# Altium project PCB2_OBC_ADCS.PrjPcb
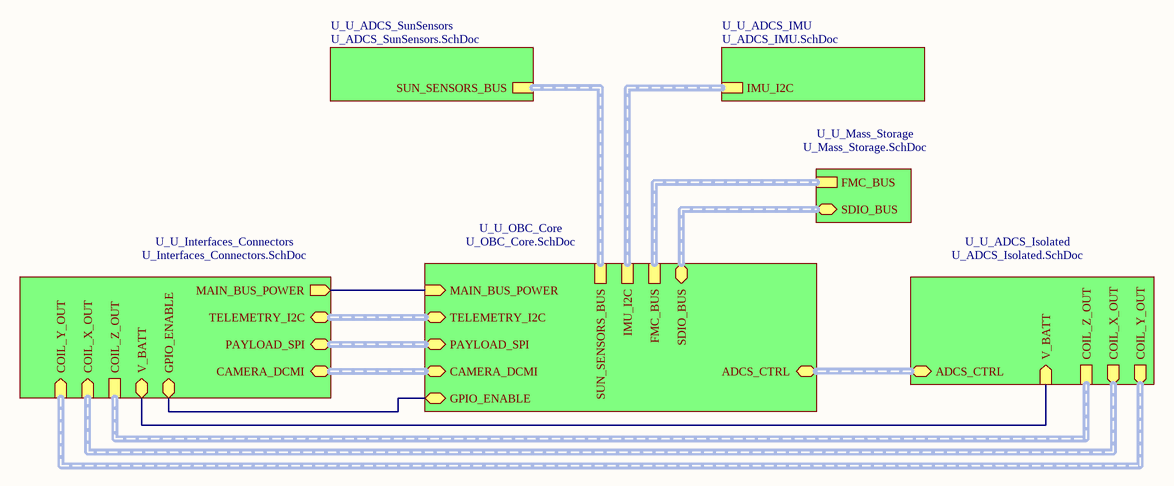
[diagram p0: Top_Level.SchDoc]
9 sheets, 53 parts. Net scope: hierarchical (ports join the sheet entries above them; power ports are global).
Board files: PCB2_OBC_ADCS_Base_Comun.PcbDoc, PCB2_OBC_ADCS_asistida.PcbDoc, PCB2_OBC_ADCS_Auto.PcbDoc
Sheets:
  Top_Level.SchDoc
    U_U_OBC_Core = U_OBC_Core.SchDoc
    U_U_Mass_Storage = U_Mass_Storage.SchDoc
      U_U_SDRAM = U_SDRAM.SchDoc
      U_U_eMMC = U_eMMC.SchDoc
    U_U_ADCS_Isolated = U_ADCS_Isolated.SchDoc
    U_U_Interfaces_Connectors = U_Interfaces_Connectors.SchDoc
    U_U_ADCS_IMU = U_ADCS_IMU.SchDoc
    U_U_ADCS_SunSensors = U_ADCS_SunSensors.SchDoc

## Sheet Top_Level.SchDoc
size A4; SheetNumber: 1; SheetTotal: 9

### Sub-sheets
U_U_ADCS_IMU = U_ADCS_IMU.SchDoc: IMU_I2C (harness IMU_I2C_DEF)
U_U_ADCS_Isolated = U_ADCS_Isolated.SchDoc: ADCS_CTRL (bidir, harness ADCS_CTRL_DEF), COIL_Y_OUT (out, harness COIL_Y_DEF), COIL_X_OUT (out, harness COIL_X_DEF), V_BATT (in), COIL_Z_OUT (harness COIL_Z_DEF)
U_U_ADCS_SunSensors = U_ADCS_SunSensors.SchDoc: SUN_SENSORS_BUS (harness SUN_ADC_DEF)
U_U_Interfaces_Connectors = U_Interfaces_Connectors.SchDoc: MAIN_BUS_POWER (out), TELEMETRY_I2C (bidir, harness I2C_DEF), PAYLOAD_SPI (bidir, harness PAYLOAD_SPI_TYPE), CAMERA_DCMI (bidir, harness DCMI_DEF), GPIO_ENABLE (bidir), COIL_Y_OUT (in, harness COIL_Y_DEF), COIL_X_OUT (in, harness COIL_X_DEF), V_BATT (bidir), COIL_Z_OUT (harness COIL_Z_DEF)
U_U_Mass_Storage = U_Mass_Storage.SchDoc: SDIO_BUS (bidir, harness SDIO_BUS_TYPE), FMC_BUS (harness FMC_BUS_TYPE)
U_U_OBC_Core = U_OBC_Core.SchDoc: MAIN_BUS_POWER (in), TELEMETRY_I2C (bidir, harness I2C_DEF), PAYLOAD_SPI (bidir, harness PAYLOAD_SPI_TYPE), CAMERA_DCMI (bidir, harness DCMI_DEF), ADCS_CTRL (bidir, harness ADCS_CTRL_DEF), GPIO_ENABLE (bidir), SUN_SENSORS_BUS (harness SUN_ADC_DEF), IMU_I2C (harness IMU_I2C_DEF), FMC_BUS (harness FMC_BUS_TYPE), SDIO_BUS (bidir, harness SDIO_BUS_TYPE)

### Nets
V_BATT: sheet U_U_ADCS_Isolated/V_BATT, sheet U_U_Interfaces_Connectors/V_BATT
NetC6_1: sheet U_U_OBC_Core/MAIN_BUS_POWER, sheet U_U_Interfaces_Connectors/MAIN_BUS_POWER
NetJ5_2: sheet U_U_OBC_Core/GPIO_ENABLE, sheet U_U_Interfaces_Connectors/GPIO_ENABLE

### Buses and harness runs
harness sheet U_U_ADCS_IMU/IMU_I2C = sheet U_U_OBC_Core/IMU_I2C
harness sheet U_U_ADCS_Isolated/ADCS_CTRL = sheet U_U_OBC_Core/ADCS_CTRL
harness sheet U_U_ADCS_Isolated/COIL_X_OUT = sheet U_U_Interfaces_Connectors/COIL_X_OUT
harness sheet U_U_ADCS_Isolated/COIL_Y_OUT = sheet U_U_Interfaces_Connectors/COIL_Y_OUT
harness sheet U_U_ADCS_Isolated/COIL_Z_OUT = sheet U_U_Interfaces_Connectors/COIL_Z_OUT
harness sheet U_U_ADCS_SunSensors/SUN_SENSORS_BUS = sheet U_U_OBC_Core/SUN_SENSORS_BUS
harness sheet U_U_Interfaces_Connectors/CAMERA_DCMI = sheet U_U_OBC_Core/CAMERA_DCMI
harness sheet U_U_Interfaces_Connectors/PAYLOAD_SPI = sheet U_U_OBC_Core/PAYLOAD_SPI
harness sheet U_U_Interfaces_Connectors/TELEMETRY_I2C = sheet U_U_OBC_Core/TELEMETRY_I2C
harness sheet U_U_Mass_Storage/FMC_BUS = sheet U_U_OBC_Core/FMC_BUS
harness sheet U_U_Mass_Storage/SDIO_BUS = sheet U_U_OBC_Core/SDIO_BUS

## Sheet U_OBC_Core.SchDoc
size A3; SheetNumber: 2; SheetTotal: 9
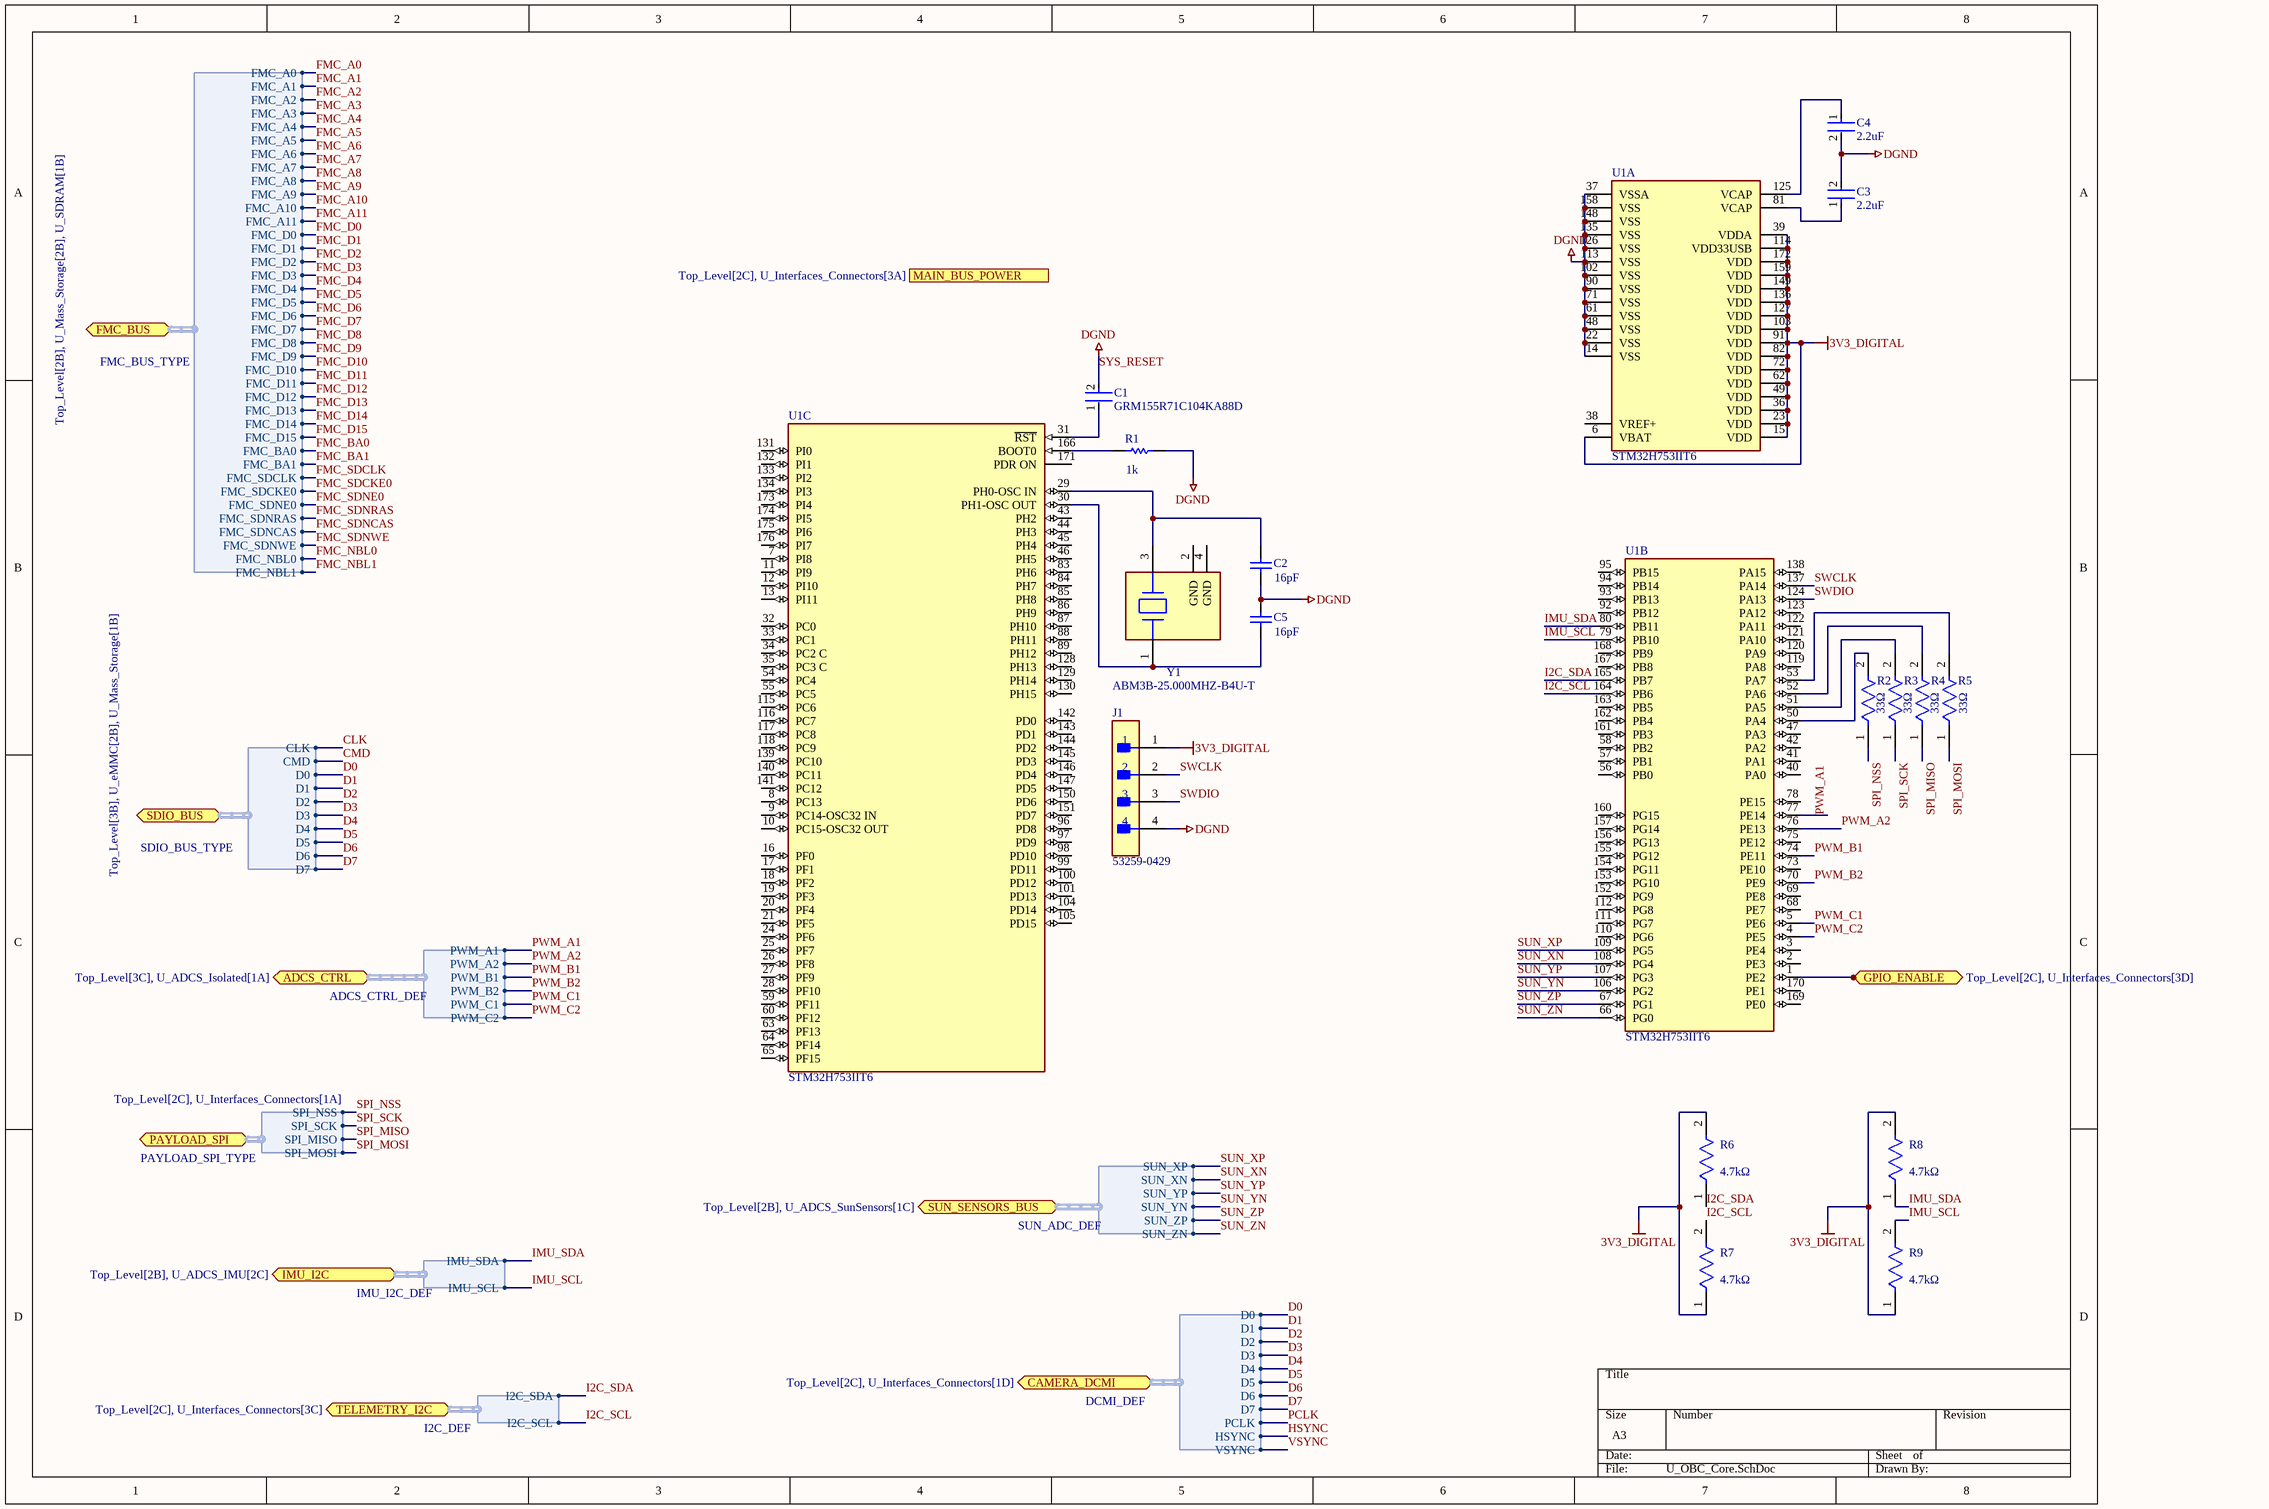
[diagram p1: U_OBC_Core.SchDoc]

### Parts
C1  GRM155R71C104KA88D  [FP-GRM15-MFG]
C2  16pF  [CAPC1005X55X25NL05T10]
C3  2.2uF  [FP-GRM188-0_1-e0_2_0_5-MFG]
C4  2.2uF  [FP-GRM188-0_1-e0_2_0_5-MFG]
C5  16pF  [CAPC1005X55X25NL05T10]
J1  53259-0429  [FP-53259-0429-MFG]
R1  1k  [RESC1609X55X30LL15T15]
R2  33Ω  [FP-CRCW0603-e3-IPC_A]
R3  33Ω  [FP-CRCW0603-e3-IPC_A]
R4  33Ω  [FP-CRCW0603-e3-IPC_A]
R5  33Ω  [FP-CRCW0603-e3-IPC_A]
R6  4.7kΩ  [FP-CRCW0603-e3-IPC_A]
R7  4.7kΩ  [FP-CRCW0603-e3-IPC_A]
R8  4.7kΩ  [FP-CRCW0603-e3-IPC_A]
R9  4.7kΩ  [FP-CRCW0603-e3-IPC_A]
U1  STM32H753IIT6  [FP-LQFP176-1T-IPC_B]  (parts A,B,C of 3)
Y1  ABM3B-25.000MHZ-B4U-T  [FP-ABM3B-MFG]

### Ports
ADCS_CTRL (bidir, harness ADCS_CTRL_DEF, see Top_Level[3C], U_ADCS_Isolated[1A]), CAMERA_DCMI (bidir, harness DCMI_DEF, see Top_Level[2C], U_Interfaces_Connectors[1D]), FMC_BUS (bidir, harness FMC_BUS_TYPE, see Top_Level[2B], U_Mass_Storage[2B], U_SDRAM[1B]), GPIO_ENABLE (bidir, see Top_Level[2C], U_Interfaces_Connectors[3D]), IMU_I2C (bidir, harness IMU_I2C_DEF, see Top_Level[2B], U_ADCS_IMU[2C]), MAIN_BUS_POWER (in, see Top_Level[2C], U_Interfaces_Connectors[3A]), PAYLOAD_SPI (bidir, harness PAYLOAD_SPI_TYPE, see Top_Level[2C], U_Interfaces_Connectors[1A]), SDIO_BUS (bidir, harness SDIO_BUS_TYPE, see Top_Level[3B], U_eMMC[2B], U_Mass_Storage[1B]), SUN_SENSORS_BUS (bidir, harness SUN_ADC_DEF, see Top_Level[2B], U_ADCS_SunSensors[1C]), TELEMETRY_I2C (bidir, harness I2C_DEF, see Top_Level[2C], U_Interfaces_Connectors[3C])

### Harnesses
PAYLOAD_SPI_TYPE: SPI_NSS, SPI_SCK, SPI_MISO, SPI_MOSI
SDIO_BUS_TYPE: CLK, CMD, D0, D1, D2, D3, D4, D5, D6, D7
FMC_BUS_TYPE: FMC_D2, FMC_D3, FMC_D4, FMC_D5, FMC_D6, FMC_D7, FMC_D8, FMC_D9, FMC_D10, FMC_D11, FMC_D12, FMC_D13, FMC_D14, FMC_D1, FMC_D15, FMC_D0, FMC_A0, FMC_A1, FMC_A2, FMC_A3, FMC_A4, FMC_A5, FMC_A6, FMC_A7, FMC_A8, FMC_A9, FMC_A10, FMC_A11, FMC_BA0, FMC_BA1, FMC_SDCLK, FMC_SDCKE0, FMC_SDNE0, FMC_SDNRAS, FMC_SDNCAS, FMC_SDNWE, FMC_NBL0, FMC_NBL1
I2C_DEF: I2C_SDA, I2C_SCL
DCMI_DEF: D0, D1, D2, D3, D4, D5, D6, D7, PCLK, HSYNC, VSYNC
IMU_I2C_DEF: IMU_SDA, IMU_SCL
SUN_ADC_DEF: SUN_XP, SUN_XN, SUN_YP, SUN_YN, SUN_ZP, SUN_ZN
ADCS_CTRL_DEF: PWM_A1, PWM_A2, PWM_B1, PWM_B2, PWM_C1, PWM_C2

### Nets
3V3_DIGITAL: J1.1 R6.2 R7.1 R8.2 R9.1 U1.6(VBAT) U1.15(VDD) U1.23(VDD) U1.36(VDD) U1.39(VDDA) U1.49(VDD) U1.62(VDD) U1.72(VDD) U1.82(VDD) U1.91(VDD) U1.103(VDD) U1.114(VDD33USB) U1.127(VDD) U1.136(VDD) U1.149(VDD) U1.159(VDD) U1.172(VDD)
DGND: C1.2 C2.1 C3.2 C4.2 C5.1 J1.4 R1.2 U1.14(VSS) U1.22(VSS) U1.37(VSSA) U1.48(VSS) U1.61(VSS) U1.71(VSS) U1.90(VSS) U1.102(VSS) U1.113(VSS) U1.126(VSS) U1.135(VSS) U1.148(VSS) U1.158(VSS)  [also labelled SYS_RESET]
D0: port SDIO_BUS.D0, port CAMERA_DCMI.D0
D1: port SDIO_BUS.D1, port CAMERA_DCMI.D1
D2: port SDIO_BUS.D2, port CAMERA_DCMI.D2
D3: port SDIO_BUS.D3, port CAMERA_DCMI.D3
D4: port SDIO_BUS.D4, port CAMERA_DCMI.D4
D5: port SDIO_BUS.D5, port CAMERA_DCMI.D5
D6: port SDIO_BUS.D6, port CAMERA_DCMI.D6
D7: port SDIO_BUS.D7, port CAMERA_DCMI.D7
I2C_SCL: R7.2 U1.164(PB6) ; port TELEMETRY_I2C.I2C_SCL
I2C_SDA: R6.1 U1.165(PB7) ; port TELEMETRY_I2C.I2C_SDA
IMU_SCL: R9.2 U1.79(PB10) ; port IMU_I2C.IMU_SCL
IMU_SDA: R8.1 U1.80(PB11) ; port IMU_I2C.IMU_SDA
PWM_A1: U1.77(PE14) ; port ADCS_CTRL.PWM_A1
PWM_A2: U1.76(PE13) ; port ADCS_CTRL.PWM_A2
PWM_B1: U1.74(PE11) ; port ADCS_CTRL.PWM_B1
PWM_B2: U1.70(PE9) ; port ADCS_CTRL.PWM_B2
PWM_C1: U1.5(PE6) ; port ADCS_CTRL.PWM_C1  [also labelled PWM_C1 ]
PWM_C2: U1.4(PE5) ; port ADCS_CTRL.PWM_C2
SPI_MISO: R4.1 ; port PAYLOAD_SPI.SPI_MISO
SPI_MOSI: R5.1 ; port PAYLOAD_SPI.SPI_MOSI
SPI_NSS: R2.1 ; port PAYLOAD_SPI.SPI_NSS
SPI_SCK: R3.1 ; port PAYLOAD_SPI.SPI_SCK
SUN_XN: U1.108(PG4) ; port SUN_SENSORS_BUS.SUN_XN
SUN_XP: U1.109(PG5) ; port SUN_SENSORS_BUS.SUN_XP
SUN_YN: U1.106(PG2) ; port SUN_SENSORS_BUS.SUN_YN
SUN_YP: U1.107(PG3) ; port SUN_SENSORS_BUS.SUN_YP
SUN_ZN: U1.66(PG0) ; port SUN_SENSORS_BUS.SUN_ZN
SUN_ZP: U1.67(PG1) ; port SUN_SENSORS_BUS.SUN_ZP
SWCLK: J1.2 U1.137(PA14)
SWDIO: J1.3 U1.124(PA13)
NetC1_1: C1.1 U1.31(~{RST})
NetC2_2: C2.2 U1.29(PH0-OSC_IN) Y1.3
NetC3_1: C3.1 U1.81(VCAP)
NetC4_1: C4.1 U1.125(VCAP)
NetC5_2: C5.2 U1.30(PH1-OSC_OUT) Y1.1
NetJ5_2: U1.1(PE2) ; port GPIO_ENABLE
NetR1_1: R1.1 U1.166(BOOT0)
NetR2_2: R2.2 U1.50(PA4)
NetR3_2: R3.2 U1.51(PA5)
NetR4_2: R4.2 U1.52(PA6)
NetR5_2: R5.2 U1.53(PA7)

Not connected (* = marked no-connect by the designer): U1 2(PE3) 3(PE4) 7(PI8) 8(PC13) 9(PC14-OSC32_IN) 10(PC15-OSC32_OUT) 11(PI9) 12(PI10) 13(PI11) 16(PF0) 17(PF1) 18(PF2) 19(PF3) 20(PF4) 21(PF5) 24(PF6) 25(PF7) 26(PF8) 27(PF9) 28(PF10) 32(PC0) 33(PC1) 34(PC2_C) 35(PC3_C) 38(VREF+) 40(PA0) 41(PA1) 42(PA2) 43(PH2) 44(PH3) 45(PH4) 46(PH5) 47(PA3) 54(PC4) 55(PC5) 56(PB0) 57(PB1) 58(PB2) 59(PF11) 60(PF12) 63(PF13) 64(PF14) 65(PF15) 68(PE7) 69(PE8) 73(PE10) 75(PE12) 78(PE15) 83(PH6) 84(PH7) 85(PH8) 86(PH9) 87(PH10) 88(PH11) 89(PH12) 92(PB12) 93(PB13) 94(PB14) 95(PB15) 96(PD8) 97(PD9) 98(PD10) 99(PD11) 100(PD12) 101(PD13) 104(PD14) 105(PD15) 110(PG6) 111(PG7) 112(PG8) 115(PC6) 116(PC7) 117(PC8) 118(PC9) 119(PA8) 120(PA9) 121(PA10) 122(PA11) 123(PA12) 128(PH13) 129(PH14) 130(PH15) 131(PI0) 132(PI1) 133(PI2) 134(PI3) 138(PA15) 139(PC10) 140(PC11) 141(PC12) 142(PD0) 143(PD1) 144(PD2) 145(PD3) 146(PD4) 147(PD5) 150(PD6) 151(PD7) 152(PG9) 153(PG10) 154(PG11) 155(PG12) 156(PG13) 157(PG14) 160(PG15) 161(PB3) 162(PB4) 163(PB5) 167(PB8) 168(PB9) 169(PE0) 170(PE1) 171(PDR_ON) 173(PI4) 174(PI5) 175(PI6) 176(PI7); Y1 2(GND) 4(GND)

### Library data of the parts
C1 = CMP-2100-03641-2: CAP CER 0.1UF 16V X7R 0402; Manufacturer: Murata; Standoff Height: 0mm; Tolerance: 10%; Voltage Rating: 16Vdc; Material: Ceramic; Capacitance: 0.10μF; Value: 0.10μF; RoHS: TRUE; Manufacturer Part Number: GRM155R71C104KA88D; Temperature Characteristic: X7R; Octopart: https://octopart.com/grm155r71c104ka88d-murata-196880; Digikey Description: CAP CER 0.1UF 16V X7R 0402; Device Class L3: Ceramic Capacitors; Height: 0.55mm; ComponentLink2Description: Datasheet; Temperature Range Low: -55°C; Ipc Land Pattern Name: CAPC10050X219; ComponentLink2URL: https://search.murata.co.jp/Ceramy/image/img/A01X/G101/ENG/GRM155R71H471KA01-01A.pdf; Device Class L1: Passive Components; Lead Free: yes; Category: Cap; Package: GRM15; Temperature: -55°C to +125°C; Device Class L2: Capacitors; Temperature Range High: +125°C; Mouser Description: 0402 0.1 uF 16V ±10 % Tolerance X7R SMT Multilayer Ceramic Capacitor
C2 C5 = CMP-2008-03924-1: Manufacturer: Murata; Part Number: GRM1555C1H160JA01D
C3 C4 = CMP-2006-02836-2: Chip Multilayer Ceramic Capacitors for General Purpose, 0603, 2.2uF, X7R, 15%, 10%, 10V; Case Code (Metric): 1608; Height: 0.8mm; Packaging: Cut Tape; Voltage: 10V; Lead Free: Lead Free; Min Operating Temperature: -55°C; Voltage Rating (DC): 10V; Max Operating Temperature: 125°C; Voltage Rating: 10V; Dielectric: X7R; Depth: 0.8mm; Case Code (Imperial): 0603; Termination: SMD/SMT; Case/Package: 0603; Number of Pins: 2; REACH SVHC: No SVHC; Mount: Surface Mount; Width: 0.031inch; Material: Ceramic; Capacitance: 2.2uF; Package Quantity: 1; Weight: 7.1E-05oz; Length: 1.6mm; Thickness: 0.035inch; Tolerance: 10%
J1 = CMP-00257-07647115-1: 53259-0429 Mighty-SPOX Header, 3.50mm Pitch, Right-Angle, 4 Circuits, Brass (CuZn) Contact; Manufacturer Lifecycle Status: ACTIVE; Number of Circuits: 4; Pitch: 3.5mm; Plating: Tin; Glow Wire Compliant: Non-compliant; Voltage Rating: 250V; Current Rating: 5.5A; Contact Material: Brass; NexarPartId: 7647115; Orientation: Right Angle; Termination: Through Hole; Number of Positions: 4; Number of Rows: 1; Country of Origin: KR; RoHS: Compliant; Contact Plating: Tin; Lifecycle Status: Production
R1 = CMP-1012-00623-3: Chip Resistor, 10 KOhm, +/- 1%, 0.1 W, -55 to 155 degC, 0603 (1608 Metric), RoHS, Tape and Reel; Manufacturer: Panasonic; Voltage Rating: 75V; Case\/Package: 0603; Power Rating: 100mW; Resistance: 10KOhm; Temperature Coefficient: 100ppm\/degreesC; Number of Pins: 2; Package Reference: 603; Depth: 0.8mm; Mount: SurfaceMount; Package Description: 2-Pin Surface Mount Device, Body 1.6 x 0.85 mm; Datasheet Version: 02/2017; Length: 1.6mm; Lead Free: LeadFree; Height: 0.45mm; Number of Terminations: 2; Max Power Dissipation: 100mW; Min Operating Temperature: -55degC; Datasheet URL: https://industrial.panasonic.com/cdbs/www-data/pdf/RDA0000/AOA0000C304.pdf; Termination: SMD/SMT; Case Code (Metric): 1608; Case Code (Imperial): 0603; Tolerance: 1%; Max Operating Temperature: 155degC; RoHSCompliant: true; Voltage Rating (DC): 75V; Radiation Hardening: No; Packaging: TapeandReel; Composition: ThickFilm; Mounting Technology: SurfaceMount; Manufacturer URL: http://www.panasonic.com/; Width: 0.031inch; REACH SVHC: NoSVHC; Contact Plating: Tin; Military Standard: Not; Package Quantity: 1
R2-R5 = CMP-2000-03250-2: RES Thick Film, 33Ω, 1%, 0.1W, 100ppm/°C, 0603; Voltage Rating: 75V; Max Power Dissipation: 100mW; Resistance: 33R; Case/Package: 0603; Weight: 7.1E-05oz; Termination: SMD/SMT; Voltage Rating (DC): 75V; Packaging: Tape and Reel; Width: 0.85mm; Depth: 0.85mm; Mount: Surface Mount; Number of Terminations: 2; Min Operating Temperature: -55°C; Military Standard: Not; Package Quantity: 10; Contact Plating: Tin; Radiation Hardening: No; Lead Free: Lead Free; Tolerance: 1%; Power Rating: 100mW; Features: Automotive AEC-Q200; Height: 0.45mm; Case Code (Metric): 1608; Length: 1.55mm; Composition: Thick Film; Max Operating Temperature: 155°C; Temperature Coefficient: 100ppm/°C; Case Code (Imperial): 0603
R6-R9 = CMP-1666-00019-3: RES Thick Film, 4.7kΩ, 1%, 0.1W, 100ppm/°C, 0603; Resistance: 4.7kR; Voltage Rating: 75V; Power Rating: 100mW; Case Code (Metric): 1608; Military Standard: Not; Packaging: Tape and Reel; Termination: SMD/SMT; Temperature Coefficient: 100ppm/°C; Lead Free: Lead Free; Length: 1.55mm; Width: 0.85mm; Height: 0.45mm; Depth: 0.85mm; Weight: 7.1E-05oz; Case Code (Imperial): 0603; Contact Plating: Tin; Case/Package: 0603; Max Operating Temperature: 155°C; Mount: Surface Mount; Tolerance: 1%; Min Operating Temperature: -55°C; Package Quantity: 5000; Voltage Rating (DC): 75V; Composition: Thick Film
U1 = STM32H753IIT6: LQFP 176 24X24X1.4; Manufacturer: STMicroelectronics; Number Of I/Os: 140; Standoff Height: 0.05mm; Memory Size: 2MBytes; Interface: I2C,SPI,UART,USART,CAN,USB,LIN,IrDA,Ethernet,I2S,SMBus,Other; Nominal Supply Current: 10-165mA; Number Of I2C Channels: 4; Number Of Timers/Counters: 20; Max Supply Voltage: 3.6V; Number Of Pwm Channels: 8; Max Junction Temp: +125°C; Number Of Uart Channels: 9; Memory Type: FLASH; Number Of Spi Channels: 6; Number Of Cores: 1; Ram Size: 1MBytes; Core Architecture: Arm Cortex-M7; Number Of Usb Channels: 2; Data Bus Width: 32bits; Frequency: 400MHz; Number Of Adc Channels: 36; Number Of A/D Converters: 3; Min Supply Voltage: 1.62V; Automotive: No; Ambient Temperature Range High: +85°C; Octopart: https://octopart.com/stm32h753iit6-stmicroelectronics-87680940; Digikey Description: LQFP 176 24X24X1.4; ComponentLink2URL: https://www.st.com/resource/en/datasheet/stm32h753ii.pdf; Manufacturer Part Number: STM32H753IIT6; RoHS: TRUE; Package: LQFP176-1T; Ambient Temperature Range Low: -40°C; Device Class L1: Integrated Circuits (ICs); Temperature: -40°C to +85°C; Ipc Land Pattern Name: QFP50P2600X2600X160-176; Category: IC; Lead Free: Yes; Device Class L2: Embedded Processors and Controllers; Temperature Range High: +85°C; ComponentLink2Description: Datasheet; Device Class L3: DSPs - Digital Signal Processors; Temperature Range Low: -40°C; Height: 1.6mm; Number Of Ethernet Channels: 1
Y1 = CMP-27762-011355-1: Crystal 25MHz ±30ppm 18pF SMD-4 5mm x 3.2mm; Frequency Stability: 10ppm; Capacitance: 1.8E-11F; ESR (Equivalent Series Resistance): 50R; Width: 0.126inch; Lead Free: Lead Free; Case/Package: SMD/SMT; Packaging: Tape and Reel; Length: 0.197inch; Load Capacitance: 18pF; Height: 0.043inch; Min Operating Temperature: -20°C; Frequency Tolerance: 30ppm; Max Operating Temperature: 70°C; Frequency: 25MHz; Mount: Surface Mount

## Sheet U_Mass_Storage.SchDoc
size A4; SheetNumber: 3; SheetTotal: 7
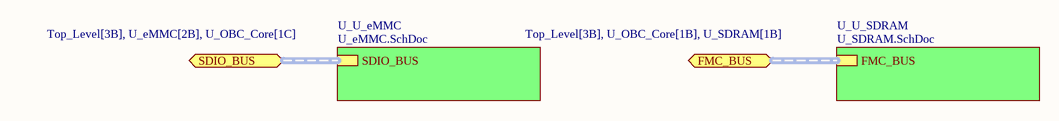
[diagram p2: U_Mass_Storage.SchDoc]

### Sub-sheets
U_U_eMMC = U_eMMC.SchDoc: SDIO_BUS (harness SDIO_BUS_TYPE)
U_U_SDRAM = U_SDRAM.SchDoc: FMC_BUS (harness FMC_BUS_TYPE)

### Ports
FMC_BUS (bidir, harness FMC_BUS_TYPE, see Top_Level[3B], U_OBC_Core[1B], U_SDRAM[1B]), SDIO_BUS (bidir, harness SDIO_BUS_TYPE, see Top_Level[3B], U_eMMC[2B], U_OBC_Core[1C])

### Buses and harness runs
harness port FMC_BUS = sheet U_U_SDRAM/FMC_BUS
harness port SDIO_BUS = sheet U_U_eMMC/SDIO_BUS

## Sheet U_SDRAM.SchDoc
size A4; SheetNumber: 4; SheetTotal: 9
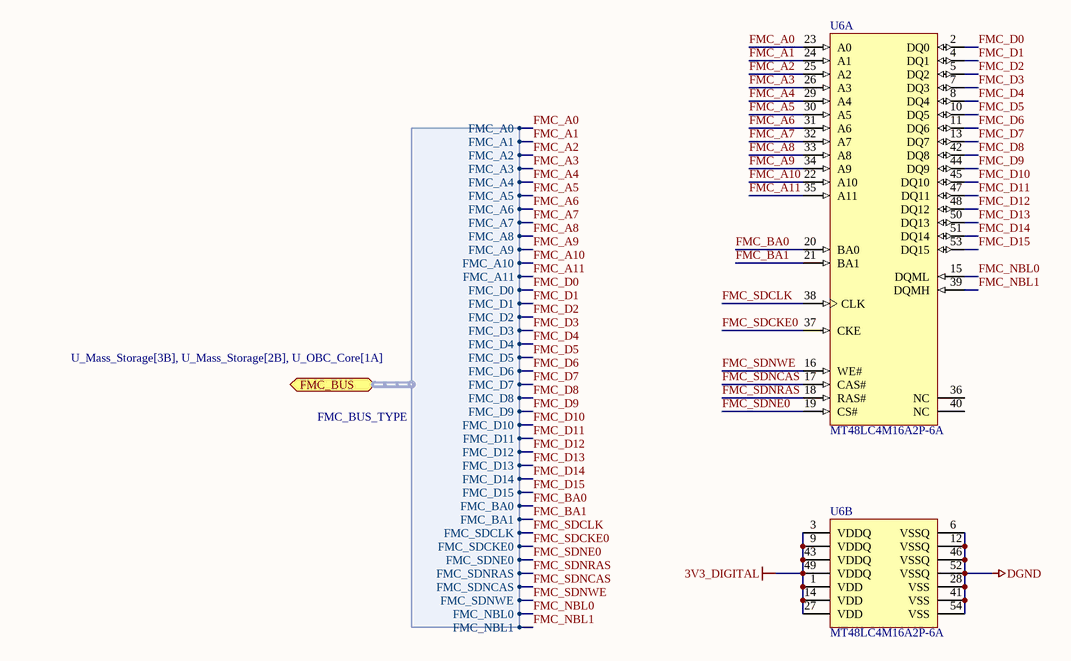
[diagram p3: U_SDRAM.SchDoc]

### Parts
U6  MT48LC4M16A2P-6A  [MICT-P-54_N]  (parts A,B of 2)

### Ports
FMC_BUS (bidir, harness FMC_BUS_TYPE, see U_Mass_Storage[3B], U_Mass_Storage[2B], U_OBC_Core[1A])

### Harnesses
FMC_BUS_TYPE: FMC_D2, FMC_D3, FMC_D4, FMC_D5, FMC_D6, FMC_D7, FMC_D8, FMC_D9, FMC_D10, FMC_D11, FMC_D12, FMC_D13, FMC_D14, FMC_D1, FMC_D15, FMC_D0, FMC_A0, FMC_A1, FMC_A2, FMC_A3, FMC_A4, FMC_A5, FMC_A6, FMC_A7, FMC_A8, FMC_A9, FMC_A10, FMC_A11, FMC_BA0, FMC_BA1, FMC_SDCLK, FMC_SDCKE0, FMC_SDNE0, FMC_SDNRAS, FMC_SDNCAS, FMC_SDNWE, FMC_NBL0, FMC_NBL1

### Nets
3V3_DIGITAL: U6.1(VDD) U6.3(VDDQ) U6.9(VDDQ) U6.14(VDD) U6.27(VDD) U6.43(VDDQ) U6.49(VDDQ)
DGND: U6.6(VSSQ) U6.12(VSSQ) U6.28(VSS) U6.41(VSS) U6.46(VSSQ) U6.52(VSSQ) U6.54(VSS)
FMC_A0: U6.23(A0) ; port FMC_BUS.FMC_A0
FMC_A1: U6.24(A1) ; port FMC_BUS.FMC_A1
FMC_A2: U6.25(A2) ; port FMC_BUS.FMC_A2
FMC_A3: U6.26(A3) ; port FMC_BUS.FMC_A3
FMC_A4: U6.29(A4) ; port FMC_BUS.FMC_A4
FMC_A5: U6.30(A5) ; port FMC_BUS.FMC_A5
FMC_A6: U6.31(A6) ; port FMC_BUS.FMC_A6
FMC_A7: U6.32(A7) ; port FMC_BUS.FMC_A7
FMC_A8: U6.33(A8) ; port FMC_BUS.FMC_A8
FMC_A9: U6.34(A9) ; port FMC_BUS.FMC_A9
FMC_A10: U6.22(A10) ; port FMC_BUS.FMC_A10
FMC_A11: U6.35(A11) ; port FMC_BUS.FMC_A11
FMC_BA0: U6.20(BA0) ; port FMC_BUS.FMC_BA0
FMC_BA1: U6.21(BA1) ; port FMC_BUS.FMC_BA1
FMC_D0: U6.2(DQ0) ; port FMC_BUS.FMC_D0
FMC_D1: U6.4(DQ1) ; port FMC_BUS.FMC_D1
FMC_D2: U6.5(DQ2) ; port FMC_BUS.FMC_D2
FMC_D3: U6.7(DQ3) ; port FMC_BUS.FMC_D3
FMC_D4: U6.8(DQ4) ; port FMC_BUS.FMC_D4
FMC_D5: U6.10(DQ5) ; port FMC_BUS.FMC_D5
FMC_D6: U6.11(DQ6) ; port FMC_BUS.FMC_D6
FMC_D7: U6.13(DQ7) ; port FMC_BUS.FMC_D7
FMC_D8: U6.42(DQ8) ; port FMC_BUS.FMC_D8
FMC_D9: U6.44(DQ9) ; port FMC_BUS.FMC_D9
FMC_D10: U6.45(DQ10) ; port FMC_BUS.FMC_D10
FMC_D11: U6.47(DQ11) ; port FMC_BUS.FMC_D11
FMC_D12: U6.48(DQ12) ; port FMC_BUS.FMC_D12
FMC_D13: U6.50(DQ13) ; port FMC_BUS.FMC_D13
FMC_D14: U6.51(DQ14) ; port FMC_BUS.FMC_D14
FMC_D15: U6.53(DQ15) ; port FMC_BUS.FMC_D15
FMC_NBL0: U6.15(DQML) ; port FMC_BUS.FMC_NBL0
FMC_NBL1: U6.39(DQMH) ; port FMC_BUS.FMC_NBL1
FMC_SDCKE0: U6.37(CKE) ; port FMC_BUS.FMC_SDCKE0
FMC_SDCLK: U6.38(CLK) ; port FMC_BUS.FMC_SDCLK
FMC_SDNCAS: U6.17(CAS#) ; port FMC_BUS.FMC_SDNCAS
FMC_SDNE0: U6.19(CS#) ; port FMC_BUS.FMC_SDNE0
FMC_SDNRAS: U6.18(RAS#) ; port FMC_BUS.FMC_SDNRAS
FMC_SDNWE: U6.16(WE#) ; port FMC_BUS.FMC_SDNWE

Not connected (* = marked no-connect by the designer): U6 36(NC) 40(NC)

### Library data of the parts
U6 = MT48LC4M16A2P: 64Mb PC133 SDR SDRAM, 4Mb x 16, 6ns, 3.3V, 0C to 70 degC, 54-Pin TSOP, Pb-Free; Manufacturer: Micron; Cycle Time: 6nsÂ; Voltage: 3.3VÂ; Op. Temp.: 0C to +70CÂ; CL: CL = 3Â; Density: 64MbÂ; Data Rate: PC133Â; Clock Rate: 166 MHzÂ; ComponentLink3URL: http://www.micron.com/~/media/Documents/Products/Data%20Sheet/DRAM/128mb_x4x8x16_sdram.pdf; Width: x16Â; Mounting Technology: Surface Mount; DatasheetVersion: Rev.Q; ComponentLink1Description: Manufacturer URL; ComponentLink2URL: http://www.micron.com/~/media/Documents/Products/Data%20Sheet/DRAM/128Mbx16x32Mobile.pdf; PackageDescription: 54-Pin Thin Small Outline Package, 10.16 x 22.22 mm, Pitch 0.8 mm; ComponentLink1URL: http://www.micron.com/; ComponentLink2Description: Datasheet; PackageVersion: Rev.Q; PartNumber: MT48LC4M16A2P-6A; RoHS: YesÂ; ComponentLink3Description: Package Specification; Depth: 4MbÂ; PackageReference: MICT-P-54

## Sheet U_eMMC.SchDoc
size A4; SheetNumber: 5; SheetTotal: 9
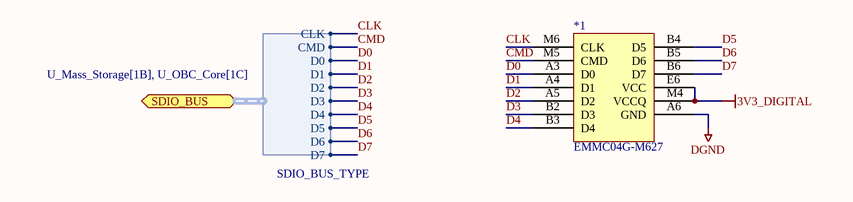
[diagram p4: U_eMMC.SchDoc]

### Parts
*1  EMMC04G-M627

### Ports
SDIO_BUS (bidir, harness SDIO_BUS_TYPE, see U_Mass_Storage[1B], U_OBC_Core[1C])

### Harnesses
SDIO_BUS_TYPE: CLK, CMD, D0, D1, D2, D3, D4, D5, D6, D7

### Nets
3V3_DIGITAL: *1.E6(VCC) *1.M4(VCCQ)
DGND: *1.A6(GND)
CLK: *1.M6(CLK) ; port SDIO_BUS.CLK
CMD: *1.M5(CMD) ; port SDIO_BUS.CMD
D0: *1.A3(D0) ; port SDIO_BUS.D0
D1: *1.A4(D1) ; port SDIO_BUS.D1
D2: *1.A5(D2) ; port SDIO_BUS.D2
D3: *1.B2(D3) ; port SDIO_BUS.D3
D4: *1.B3(D4) ; port SDIO_BUS.D4
D5: *1.B4(D5) ; port SDIO_BUS.D5
D6: *1.B5(D6) ; port SDIO_BUS.D6
D7: *1.B6(D7) ; port SDIO_BUS.D7

## Sheet U_ADCS_Isolated.SchDoc
size A4; SheetNumber: 6; SheetTotal: 9
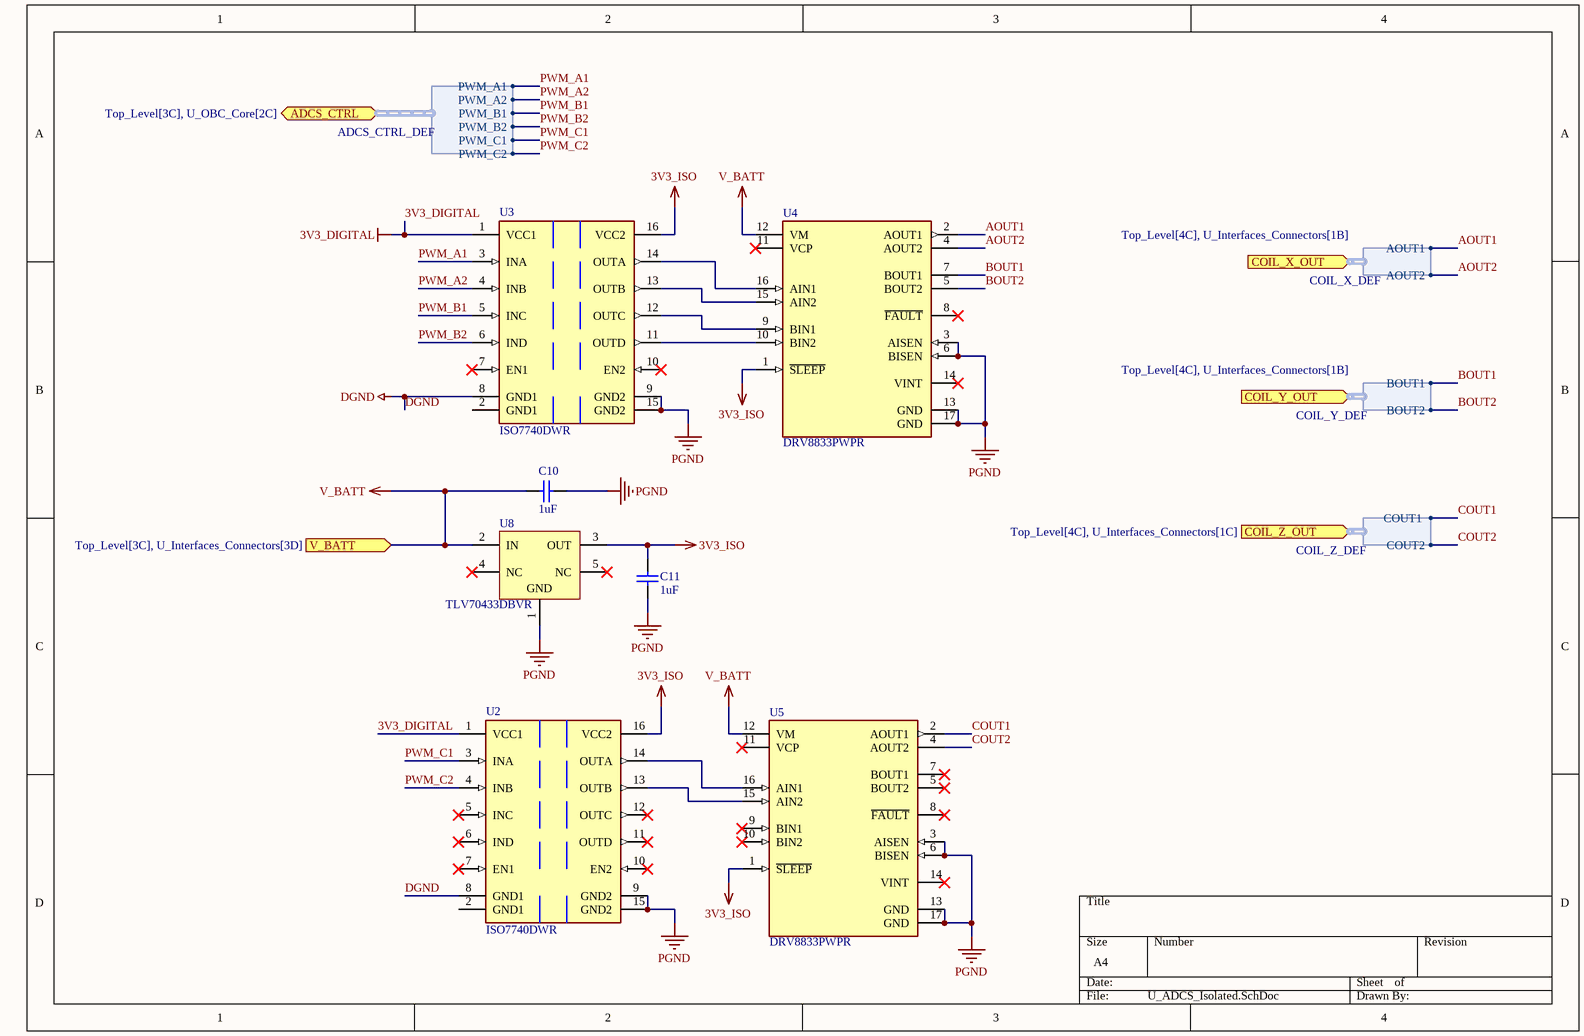
[diagram p5: U_ADCS_Isolated.SchDoc]

### Parts
C10  1uF  [CAPC2013X140X50NL20T25]
C11  1uF  [CAPC2013X140X50NL20T25]
U2  ISO7740DWR  [FP-DW0016B-MFG]
U3  ISO7740DWR  [FP-DW0016B-MFG]
U4  DRV8833PWPR  [FP-PWP0016C-IPC_A]
U5  DRV8833PWPR  [FP-PWP0016C-IPC_A]
U8  TLV70433DBVR  [DBV0005A_M]

### Ports
ADCS_CTRL (bidir, harness ADCS_CTRL_DEF, see Top_Level[3C], U_OBC_Core[2C]), COIL_X_OUT (in, harness COIL_X_DEF, see Top_Level[4C], U_Interfaces_Connectors[1B]), COIL_Y_OUT (in, harness COIL_Y_DEF, see Top_Level[4C], U_Interfaces_Connectors[1B]), COIL_Z_OUT (in, harness COIL_Z_DEF, see Top_Level[4C], U_Interfaces_Connectors[1C]), V_BATT (in, see Top_Level[3C], U_Interfaces_Connectors[3D])

### Harnesses
ADCS_CTRL_DEF: PWM_A1, PWM_A2, PWM_B1, PWM_B2, PWM_C1, PWM_C2
COIL_X_DEF: AOUT1, AOUT2
COIL_Y_DEF: BOUT1, BOUT2
COIL_Z_DEF: COUT1 , COUT2

### Nets
3V3_DIGITAL: U2.1(VCC1) U3.1(VCC1)
3V3_ISO: C11.2 U2.16(VCC2) U3.16(VCC2) U4.1(~{SLEEP}) U5.1(~{SLEEP}) U8.3(OUT)
DGND: U2.8(GND1) U3.8(GND1)
PGND: C10.2 C11.1 U2.9(GND2) U2.15(GND2) U3.9(GND2) U3.15(GND2) U4.3(AISEN) U4.6(BISEN) U4.13(GND) U4.17(GND) U5.3(AISEN) U5.6(BISEN) U5.13(GND) U5.17(GND) U8.1(GND)
V_BATT: C10.1 U4.12(VM) U5.12(VM) U8.2(IN) ; port V_BATT
AOUT1: U4.2(AOUT1) ; port COIL_X_OUT.AOUT1
AOUT2: U4.4(AOUT2) ; port COIL_X_OUT.AOUT2
BOUT1: U4.7(BOUT1) ; port COIL_Y_OUT.BOUT1
BOUT2: U4.5(BOUT2) ; port COIL_Y_OUT.BOUT2
COUT1: U5.2(AOUT1) ; port COIL_Z_OUT.COUT1 
COUT2: U5.4(AOUT2) ; port COIL_Z_OUT.COUT2
PWM_A1: U3.3(INA) ; port ADCS_CTRL.PWM_A1
PWM_A2: U3.4(INB) ; port ADCS_CTRL.PWM_A2
PWM_B1: U3.5(INC) ; port ADCS_CTRL.PWM_B1
PWM_B2: U3.6(IND) ; port ADCS_CTRL.PWM_B2
PWM_C1 : U2.3(INA) ; port ADCS_CTRL.PWM_C1  [project net PWM_C1]
PWM_C2: U2.4(INB) ; port ADCS_CTRL.PWM_C2
NetU2_13: U2.13(OUTB) U5.15(AIN2)
NetU2_14: U2.14(OUTA) U5.16(AIN1)
NetU3_11: U3.11(OUTD) U4.10(BIN2)
NetU3_12: U3.12(OUTC) U4.9(BIN1)
NetU3_13: U3.13(OUTB) U4.15(AIN2)
NetU3_14: U3.14(OUTA) U4.16(AIN1)

Not connected (* = marked no-connect by the designer): U2 2(GND1) 5(INC)* 6(IND)* 7(EN1)* 10(EN2)* 11(OUTD)* 12(OUTC)*; U3 2(GND1) 7(EN1)* 10(EN2)*; U4 8(~{FAULT})* 11(VCP)* 14(VINT)*; U5 5(BOUT2)* 7(BOUT1)* 8(~{FAULT})* 9(BIN1)* 10(BIN2)* 11(VCP)* 14(VINT)*; U8 4(NC)* 5(NC)*

### Library data of the parts
C10 C11 = CMP-2007-04663-1: Part Number: 0805YD105MAT2A; Manufacturer: AVX Interconnect / Elco
U2 U3 = CMP-04872-000013-1: DGTL ISO 5KV 4CH GEN PURP 16SOIC; Manufacturer Part Number: ISO7741DWR; Manufacturer: Texas Instruments; Nominal Supply Current: 1.5-18mA; Standoff Height: 0.1mm; Min Supply Voltage: 2.25V; Max Supply Voltage: 5.5V; Max Junction Temp: +150°C; ComponentLink2Description: Datasheet; Temperature Range Low: -55°C; Device Class L2: Interface ICs; Package: DW0016B; Temperature: -55°C to +125°C; Mouser Description: High-speed, low-power, robust EMC quad-channel digital isolator 16-SOIC -55 to 125; Octopart: https://octopart.com/iso7741dwr-texas+instruments-71651905; RoHS: TRUE; Category: IC; Ambient Temperature Range Low: -55°C; Height: 2.65mm; Device Class L3: unset; Device Class L1: Integrated Circuits (ICs); Digikey Description: DGTL ISO 5KV 4CH GEN PURP 16SOIC; Automotive: No; Temperature Range High: +125°C; Ambient Temperature Range High: +125°C; Lead Free: Yes; ComponentLink2URL: http://www.ti.com/lit/ds/symlink/iso7741.pdf; Ipc Land Pattern Name: SOIC127P1030X265-16
U4 U5 = CMP-1529-00004-3: IC MOTOR DRIVER PAR 16HTSSOP; Supply Current: 3mA; Max Output Current: 2A; Interface: PWM; Output Current: 1.5A; Max Supply Voltage: 10.8V; Fault Protection: Over Temperature; Number of Outputs: 2; Min Supply Voltage: 2.7V; Nominal Supply Current: 3mA; Series: DRV8833; Min Operating Temperature: -40°C; Package Quantity: 2000; Packaging: Tape and Reel; Case/Package: HTSSOP; Output Current per Channel: 1.5A; RoHS Compliant: Yes; RMS Current (Irms): 1.5A; Max Operating Temperature: 85°C; Technology: NMOS; Number of Pins: 16; Radiation Hardening: No; Lead Free: Lead Free; REACH SVHC: No SVHC
U8 = CMP-0394-00651-2: Single Output LDO, 150 mA, Fixed 3.3 V Output, 2.5 to 24 V Input, with Ultra-Low IQ, 5-pin SOT-23 (DBV), -40 to 125 degC, Green (RoHS & no Sb/Br); Manufacturer: Texas Instruments; Vdo(Typ)(mV): 400; Accuracy(%): 2; Vin(Min)(V): 2.5; Vin(Max)(V): 24; SubFamily: Single Channel LDO; Iq(Typ)(mA): 0.003; Fixed Output Options(V): 3.3; Iout(Max)(A): 0.15; DatasheetVersion: SBVS148C; ComponentLink1URL: http://www.ti.com/; ComponentLink3URL: http://www.ti.com/litv/pdf/mpds018i; Code_JEDEC: MO-178; PackageReference: DBV0005A; PackageDescription: 5-Pin Plastic Small Outline, Body 1.60 Ãƒâ€” 2.90 mm, Pitch 0.95 mm; Mounting Technology: Surface Mount; ComponentLink1Description: Manufacturer URL; Vout Adj(Min)(V): 3.3; PartNumber: TLV70433DBVR; ComponentLink2Description: Datasheet; PackageVersion: 4073253-4/K; ComponentLink2URL: http://www.ti.com/general/docs/lit/getliterature.tsp?genericPartNumber=TLV70433&fileType=pdf; ComponentLink3Description: Package Specification; Vout Adj(Max)(V): 3.3; Eco-Plan: Green (RoHS & no Sb/Br)

## Sheet U_Interfaces_Connectors.SchDoc
size A4; SheetNumber: 7; SheetTotal: 9
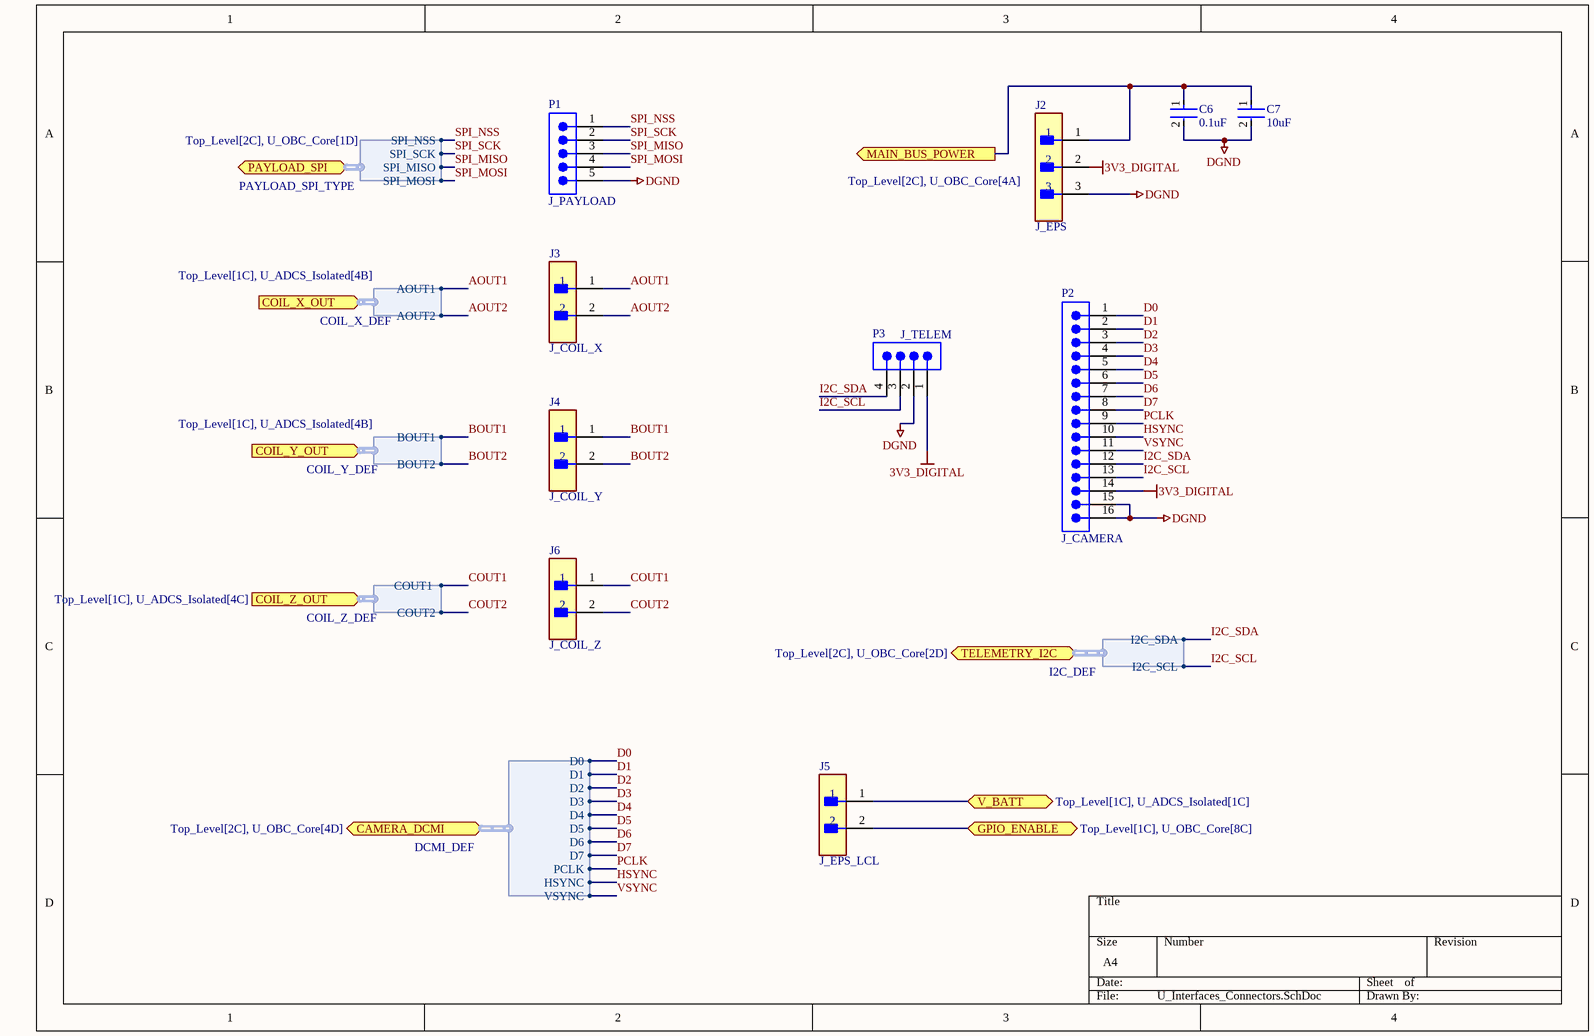
[diagram p6: U_Interfaces_Connectors.SchDoc]

### Parts
C6  0.1uF  [FP-CC0603-DA-MFG]
C7  10uF  [FP-CC0805-0_2-1_45-IPC_A]
J2  J_EPS  [FP-TSW-103-22-G-S-MFG]
J3  J_COIL_X  [FP-TSW-102-22-G-S-MFG]
J4  J_COIL_Y  [FP-TSW-102-22-G-S-MFG]
J5  J_EPS_LCL  [FP-TSW-102-22-G-S-MFG]
J6  J_COIL_Z  [FP-TSW-102-22-G-S-MFG]
P1  J_PAYLOAD  [SMTC-TSW-105-05-X-S]
P2  J_CAMERA  [SMTC-MTLW-116-07-X-S-265]
P3  J_TELEM  [SMTC-TSW-104-08-X-S]

### Ports
CAMERA_DCMI (bidir, harness DCMI_DEF, see Top_Level[2C], U_OBC_Core[4D]), COIL_X_OUT (in, harness COIL_X_DEF, see Top_Level[1C], U_ADCS_Isolated[4B]), COIL_Y_OUT (in, harness COIL_Y_DEF, see Top_Level[1C], U_ADCS_Isolated[4B]), COIL_Z_OUT (in, harness COIL_Z_DEF, see Top_Level[1C], U_ADCS_Isolated[4C]), GPIO_ENABLE (bidir, see Top_Level[1C], U_OBC_Core[8C]), MAIN_BUS_POWER (out, see Top_Level[2C], U_OBC_Core[4A]), PAYLOAD_SPI (bidir, harness PAYLOAD_SPI_TYPE, see Top_Level[2C], U_OBC_Core[1D]), TELEMETRY_I2C (bidir, harness I2C_DEF, see Top_Level[2C], U_OBC_Core[2D]), V_BATT (bidir, see Top_Level[1C], U_ADCS_Isolated[1C])

### Harnesses
PAYLOAD_SPI_TYPE: SPI_NSS, SPI_SCK, SPI_MISO, SPI_MOSI
COIL_X_DEF: AOUT1, AOUT2
I2C_DEF: I2C_SDA, I2C_SCL
COIL_Y_DEF: BOUT1, BOUT2
DCMI_DEF: D0, D1, D2, D3, D4, D5, D6, D7, PCLK, HSYNC, VSYNC
COIL_Z_DEF: COUT1 , COUT2

### Nets
3V3_DIGITAL: J2.2 P2.14 P3.1
DGND: C6.2 C7.2 J2.3 P1.5 P2.15 P2.16 P3.2
V_BATT: J5.1 ; port V_BATT
AOUT1: J3.1 ; port COIL_X_OUT.AOUT1
AOUT2: J3.2 ; port COIL_X_OUT.AOUT2
BOUT1: J4.1 ; port COIL_Y_OUT.BOUT1
BOUT2: J4.2 ; port COIL_Y_OUT.BOUT2
COUT1: J6.1 ; port COIL_Z_OUT.COUT1   [also labelled COUT1 ]
COUT2: J6.2 ; port COIL_Z_OUT.COUT2
D0: P2.1 ; port CAMERA_DCMI.D0
D1: P2.2 ; port CAMERA_DCMI.D1
D2: P2.3 ; port CAMERA_DCMI.D2
D3: P2.4 ; port CAMERA_DCMI.D3
D4: P2.5 ; port CAMERA_DCMI.D4
D5: P2.6 ; port CAMERA_DCMI.D5
D6: P2.7 ; port CAMERA_DCMI.D6
D7: P2.8 ; port CAMERA_DCMI.D7
HSYNC: P2.10 ; port CAMERA_DCMI.HSYNC
I2C_SCL: P2.13 P3.3 ; port TELEMETRY_I2C.I2C_SCL
I2C_SDA: P2.12 P3.4 ; port TELEMETRY_I2C.I2C_SDA
PCLK: P2.9 ; port CAMERA_DCMI.PCLK
SPI_MISO: P1.3 ; port PAYLOAD_SPI.SPI_MISO
SPI_MOSI: P1.4 ; port PAYLOAD_SPI.SPI_MOSI
SPI_NSS: P1.1 ; port PAYLOAD_SPI.SPI_NSS
SPI_SCK: P1.2 ; port PAYLOAD_SPI.SPI_SCK
VSYNC: P2.11 ; port CAMERA_DCMI.VSYNC
NetC6_1: C6.1 C7.1 J2.1 ; port MAIN_BUS_POWER
NetJ5_2: J5.2 ; port GPIO_ENABLE

### Library data of the parts
C6 = CMP-2100-03601-2: CAP CER 0.1UF 50V X7R 0603; Manufacturer: YAGEO; Manufacturer Part Number: CC0603KRX7R9BB104; Material: Ceramic; Capacitance: 100 nF; Temperature Coefficient: 15%; Tolerance: 0.1; Value: 100 nF; Height: 0.9mm; Voltage: 50 V; ComponentLink2Description: Datasheet; Device Class L2: Capacitors; Temperature Range High: +125°C; Category: Cap; Footprint Url: http://www.yageo.com/exep/pages/download/literatures/UPY-C_GEN_24.pdf; ComponentLink2URL: http://www.yageo.com/documents/recent/UPY-GPHC_X7R_6.3V-to-50V_18.pdf; Package: CC0603-DA; Temperature: -55°C to +125°C; Voltage Rating: 50 V; Temperature Characteristic: X7R; Device Class L1: Passive Components; Temperature Range Low: -55°C; RoHS: TRUE; Automotive: No; Device Class L3: Ceramic Capacitors; Octopart: https://octopart.com/cc0603krx7r9bb104-yageo-42244635; Mouser Description: Multilayer Ceramic Capacitor, CC Series, 0.1 - F, - 10%, X7R, 50 V, 0603 [1608 Metric]; Lead Free: Yes; Digikey Description: CAP CER 0.1UF 50V X7R 0603
C7 = CMP-1036-04922-3: CAP CER 10UF 10V X5R 0805; Tolerance: 10%; Dissipation Factor: 15%; Voltage Rating: 10V; Case/Package: 0805; Series: CC; Package Quantity: 1; Max Operating Temperature: 85°C; Min Operating Temperature: -55°C; Radiation Hardening: No; Termination: SMD/SMT; Voltage Rating (DC): 10V; Width: 0.049inch; Height: 0.85mm; Packaging: Tape and Reel; Voltage: 10V; Halogen Free: Halogen Free; Lead Free: Lead Free; Case Code (Imperial): 0805; Resistor Type: Ceramic; Length: 2mm; Construction: Flat; Mount: Surface Mount; Capacitance: 10uF; Depth: 1.25mm; Number of Pins: 2; Dielectric: X5R; RoHS Compliant: Yes; Case Code (Metric): 2012
J2 = CMP-02766-000544-1: Conn Unshrouded Header HDR 3 POS 2.54mm Solder ST Thru-Hole Bulk; Max Current Rating: 7.6A; Gender: Male; Max Voltage Rating (AC): 550V; Number of Contacts: 3; Orientation: Straight; REACH SVHC: No SVHC; Pitch: 2.54mm; Termination: Solder; Length: 7.62mm; Contact Material: Bronze; Housing Color: Black; Housing Material: Polyester; Number of Rows: 1; Contact Plating: Gold; Min Operating Temperature: -55°C; Packaging: Bulk; Depth: 2.54mm; Max Operating Temperature: 125°C
J3-J6 = CMP-02766-000117-1: CONN HEADER VERT 2POS 2.54MM; Max Voltage Rating (AC): 550V; Gender: Male; Max Current Rating: 7.6A; Number of Contacts: 2; Housing Color: Black; Max Operating Temperature: 125°C; Orientation: Straight; Depth: 2.54mm; Pitch: 2.54mm; Housing Material: Polyester; Packaging: Bulk; Termination: Solder; Contact Plating: Gold; Length: 5.08mm; Number of Rows: 1; Radiation Hardening: No; Min Operating Temperature: -55°C; REACH SVHC: No SVHC; Contact Material: Bronze
P1 = CMP-1024-00366-1: 0.025" SQ Post Header, Through-hole, Vertical, -55 to 125 degC, 2.54 mm Pitch, 5-Pin, Male, RoHS; PartNumber: TSW-105-05-L-S; Manufacturer: Samtec; Pitch: 2.54 mm; PackageVersion: DM, 8/1988; Orientation: Vertical; Temperature Range: -55 to 125 degC; ComponentLink1Description: Manufacturer URL; PackageDescription: .025[0.64] SQ. Post Terminal Strip Assembly; ComponentLink2URL: http://www.samtec.com/documents/webfiles/pdf/TSW_TH.PDF; PackageReference: TSW-105-05-X-S; ComponentLink2Description: Datasheet; Mounting Technology: Through-hole; DatasheetVersion: F-214; ComponentLink1URL: http://www.samtec.com; RoHS: True; ComponentLink3URL: http://www.samtec.com/documents/webfiles/cpdf/TSW-XXX-XX-XXX-X-XX-XXX-MKT.pdf; ComponentLink3Description: Package Specification
P2 = CMP-1024-00092-1: Low Profile .025" SQ Post Header, Through-hole, Vertical, -55 to 125 degC, 2.54 mm Pitch, 16-Pin, Male, RoHS; Manufacturer: Samtec; PartNumber: MTLW-116-07-G-S-265; Pitch: 2.54 mm; Orientation: Vertical; RoHS: True; ComponentLink2URL: http://www.samtec.com/documents/webfiles/pdf/MTLW_TH.PDF; ComponentLink1URL: http://www.samtec.com; ComponentLink3URL: http://www.samtec.com/documents/webfiles/cpdf/MTLW-1XX-XX-XX-X-XXX-XX-XX-MKT1.pdf; PackageVersion: T, 6/1991; Temperature Range: -55 to 125 degC; Mounting Technology: Through-hole; ComponentLink3Description: Package Specification; ComponentLink1Description: Manufacturer URL; ComponentLink2Description: Datasheet; PackageDescription: Low Profile Terminal Assembly; DatasheetVersion: F-214; PackageReference: MTLW-116-07-X-S-265
P3 = CMP-1024-00358-1: 0.025" SQ Post Header, Through-hole, Vertical, -55 to 125 degC, 2.54 mm Pitch, 4-Pin, Male, RoHS; PartNumber: TSW-104-08-L-S; Manufacturer: Samtec; Pitch: 2.54 mm; RoHS: True; Temperature Range: -55 to 125 degC; PackageDescription: .025[0.64] SQ. Post Terminal Strip Assembly; Orientation: Vertical; ComponentLink2URL: http://www.samtec.com/documents/webfiles/pdf/TSW_TH.PDF; ComponentLink1Description: Manufacturer URL; ComponentLink2Description: Datasheet; PackageVersion: DM, 8/1988; ComponentLink3URL: http://www.samtec.com/documents/webfiles/cpdf/TSW-XXX-XX-XXX-X-XX-XXX-MKT.pdf; Mounting Technology: Through-hole; PackageReference: TSW-104-08-X-S; ComponentLink3Description: Package Specification; ComponentLink1URL: http://www.samtec.com; DatasheetVersion: F-214

## Sheet U_ADCS_IMU.SchDoc
size A4; SheetNumber: 8; SheetTotal: 9
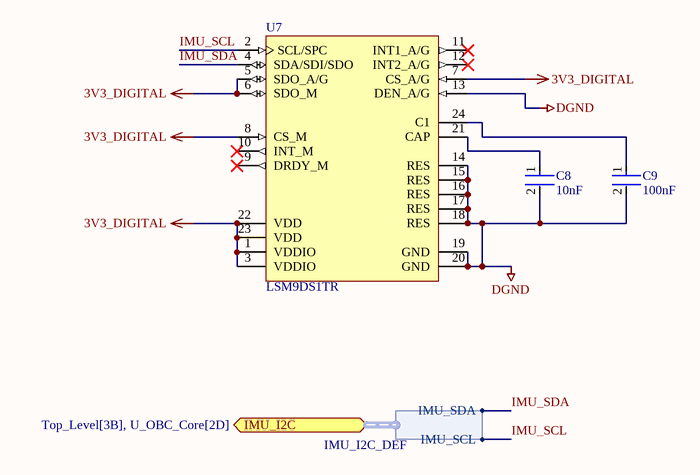
[diagram p7: U_ADCS_IMU.SchDoc]

### Parts
C8  10nF  [FP-GRM155-0_05-MFG]
C9  100nF  [FP-GRM21B-0_1-MFG]
U7  LSM9DS1TR  [STM-LGA-24_3500X3000X1000]

### Ports
IMU_I2C (bidir, harness IMU_I2C_DEF, see Top_Level[3B], U_OBC_Core[2D])

### Harnesses
IMU_I2C_DEF: IMU_SDA, IMU_SCL

### Nets
3V3_DIGITAL: U7.1(VDDIO) U7.3(VDDIO) U7.5(SDO_A/G) U7.6(SDO_M) U7.7(CS_A/G) U7.8(CS_M) U7.22(VDD) U7.23(VDD)
DGND: C8.2 C9.2 U7.13(DEN_A/G) U7.14(RES) U7.15(RES) U7.16(RES) U7.17(RES) U7.18(RES) U7.19(GND) U7.20(GND)
IMU_SCL: U7.2(SCL/SPC) ; port IMU_I2C.IMU_SCL
IMU_SDA: U7.4(SDA/SDI/SDO) ; port IMU_I2C.IMU_SDA
NetC8_1: C8.1 U7.21(CAP)
NetC9_1: C9.1 U7.24(C1)

Not connected (* = marked no-connect by the designer): U7 9(DRDY_M)* 10(INT_M)* 11(INT1_A/G)* 12(INT2_A/G)*

### Library data of the parts
C8 = CMP-06035-007234-1: Chip Multilayer Ceramic Capacitors for General Purpose, 0402, 10000pF, X7R, 15%, 5%, 50V; Packaging: Tape and Reel; Tolerance: 5%; Voltage Rating (DC): 50V; Dielectric: X7R; Package Quantity: 50000; Weight: 0.000212oz; Thickness: 500um; Capacitance: 10nF; Length: 1mm; Width: 500um
C9 = CMP-06035-043106-1: Chip Multilayer Ceramic Capacitors for General Purpose, 0805, 0.10uF, U2J, -750ppm/°C, 5%, 10V; Dielectric: U2J; Voltage Rating (DC): 10V; Thickness: 1.25mm; Width: 1.25mm; Length: 2mm; Case/Package: 0805; Capacitance: 100nF; Tolerance: 5%
U7 = CMP-2000-06606-1: iNEMO Inertial Module: 3D Accelerometer, 3D Gyroscope, 3D Magnetometer, 1.9 to 3.6 V, -40 to 85 degC, 24-Pin LGA, RoHS, Tape and Reel; Manufacturer: STMicroelectronics; SVHC: NoSVHC(17-Dec-2015); MEMS Module Function: Tri-AxisGyroscope,Tri-AxisAccelerometer,Tri-AxisMagnetometer; Supply Voltage Max: 3.6V; No. of Pins: 24Pins; Gyroscope Range: ±245°/s,±500°/s,±2000°/s; Acceleration Range: ±2g,±4g,±8g,±16g; Supply Voltage Min: 1.9V; Package Description: 24-Pin Plastic Land Grid Array Package, Body 3.65 x 3.15 mm, Pitch 0.43 mm; Manufacturer URL: http://www.st.com/; PartNumber: LSM9DS1; Product Range: -; Packaging: CutTape; Sensor Case Style: LGA; Datasheet URL: http://www2.st.com/content/ccc/resource/technical/document/datasheet/1e/3f/2a/d6/25/eb/48/46/DM00103319.pdf/files/DM00103319.pdf/jcr:content/translations/en.DM00103319.pdf; Package Reference: LGA-24_3500X3000X1000; Mounting Technology: SurfaceMount; Datasheet Version: Rev. 3, 03/2015; MSL: MSL3-168hours

## Sheet U_ADCS_SunSensors.SchDoc
size A4; SheetNumber: 9; SheetTotal: 9
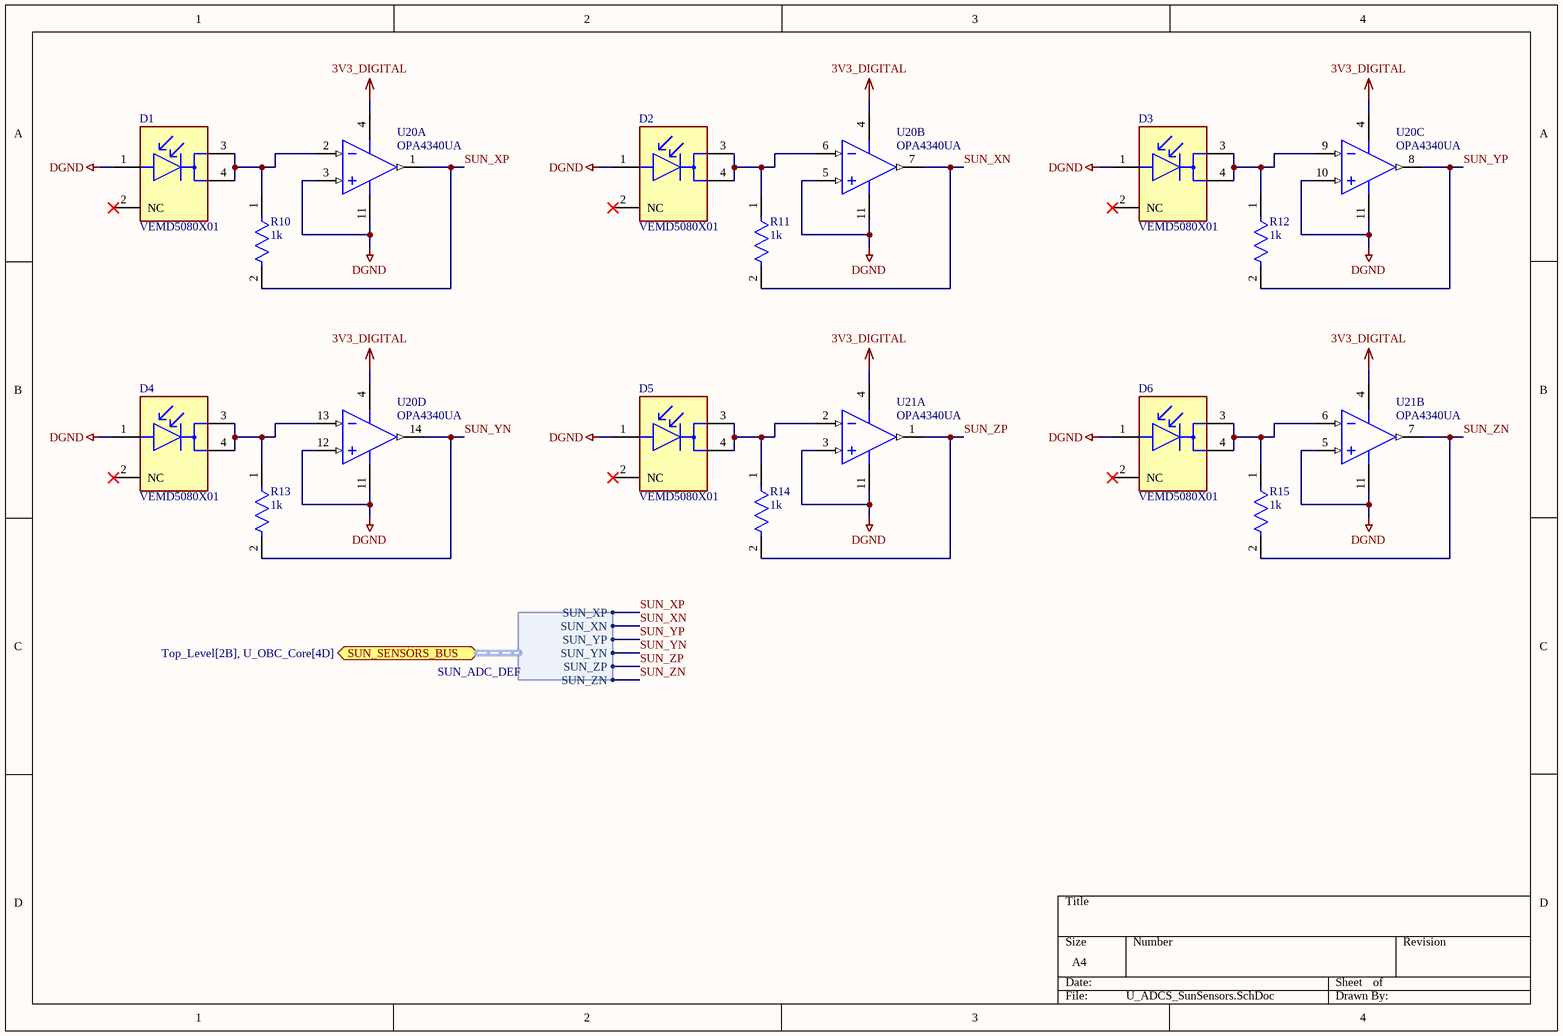
[diagram p8: U_ADCS_SunSensors.SchDoc]

### Parts
D1  VEMD5080X01  [FP-6_550-5329_01-4-MFG]
D2  VEMD5080X01  [FP-6_550-5329_01-4-MFG]
D3  VEMD5080X01  [FP-6_550-5329_01-4-MFG]
D4  VEMD5080X01  [FP-6_550-5329_01-4-MFG]
D5  VEMD5080X01  [FP-6_550-5329_01-4-MFG]
D6  VEMD5080X01  [FP-6_550-5329_01-4-MFG]
R10  1k  [FP-CRGCQ0603-IPC_C]
R11  1k  [FP-CRGCQ0603-IPC_C]
R12  1k  [FP-CRGCQ0603-IPC_C]
R13  1k  [FP-CRGCQ0603-IPC_C]
R14  1k  [FP-CRGCQ0603-IPC_C]
R15  1k  [FP-CRGCQ0603-IPC_C]
U20  OPA4340UA  [D0014A_N]  (parts A,B,C,D of 4)
U21  OPA4340UA  [D0014A_N]  (parts A,B of 4)

### Ports
SUN_SENSORS_BUS (bidir, harness SUN_ADC_DEF, see Top_Level[2B], U_OBC_Core[4D])

### Harnesses
SUN_ADC_DEF: SUN_XP, SUN_XN, SUN_YP, SUN_YN, SUN_ZP, SUN_ZN

### Nets
3V3_DIGITAL: U20.4(V+) U21.4(V+)
DGND: D1.1(A) D2.1(A) D3.1(A) D4.1(A) D5.1(A) D6.1(A) U20.3(IN_A+) U20.5(IN_B+) U20.10(IN_C+) U20.11(V-) U20.12(IN_D+) U21.3(IN_A+) U21.5(IN_B+) U21.11(V-)
SUN_XN: R11.2 U20.7(OUT_B) ; port SUN_SENSORS_BUS.SUN_XN
SUN_XP: R10.2 U20.1(OUT_A) ; port SUN_SENSORS_BUS.SUN_XP
SUN_YN: R13.2 U20.14(OUT_D) ; port SUN_SENSORS_BUS.SUN_YN
SUN_YP: R12.2 U20.8(OUT_C) ; port SUN_SENSORS_BUS.SUN_YP
SUN_ZN: R15.2 U21.7(OUT_B) ; port SUN_SENSORS_BUS.SUN_ZN
SUN_ZP: R14.2 U21.1(OUT_A) ; port SUN_SENSORS_BUS.SUN_ZP
NetD1_3: D1.3(C) D1.4(C) R10.1 U20.2(IN_A-)
NetD2_3: D2.3(C) D2.4(C) R11.1 U20.6(IN_B-)
NetD3_3: D3.3(C) D3.4(C) R12.1 U20.9(IN_C-)
NetD4_3: D4.3(C) D4.4(C) R13.1 U20.13(IN_D-)
NetD5_3: D5.3(C) D5.4(C) R14.1 U21.2(IN_A-)
NetD6_3: D6.3(C) D6.4(C) R15.1 U21.6(IN_B-)

Not connected (* = marked no-connect by the designer): D1 2(NC)*; D2 2(NC)*; D3 2(NC)*; D4 2(NC)*; D5 2(NC)*; D6 2(NC)*

### Library data of the parts
D1-D6 = CMP-02531-000007-1: PHOTODIODE 750 TO 1050 NM; Viewing Angle: 65°; Max Reverse Voltage (DC): 20V; Response Time: 70ns; Wavelength: 950nm; Diode Type: PIN; Min Operating Temperature: -40°C; RoHS Compliant: Yes; Max Operating Temperature: 110°C; Packaging: Tape and Reel; Mount: Surface Mount; Case/Package: SMD/SMT
R10-R15 = CMP-03211-008566-1: CRGCQ0603 1KΩ 1% ±100ppm/°C 75V; Manufacturer Part Number: CRGCQ0603F1K0; Manufacturer: TE Connectivity; Tolerance: 0.01; Power Rating: 0.1W; Device Class L3: Chip SMD Resistors; Height: 0.55mm; Lead Free: Yes; Value: 1KΩ; ComponentLink2Description: Datasheet; Category: Res; RoHS: TRUE; Series: CRGCQ; Ipc Land Pattern Name: RESC16080X45; Temperature: -55°C to +155°C; Device Class L2: Resistors; Package: CRGCQ0603; Ambient Temperature Range High: +70°C; Octopart: https://octopart.com/crgcq0603f1k0-te+connectivity-91018050; Temperature Range High: +155°C; ComponentLink2URL: https://www.te.com/commerce/DocumentDelivery/DDEController?Action=showdoc&DocId=Data+Sheet%7F1773204-3%7F1%7Fpdf%7FEnglish%7FENG_DS_1773204-3_1.pdf%7F4-2176339-694; Temperature Coefficient: ±100ppm/°C; Voltage Rating: 75V; Composition: Thick Film; Resistance: 1KΩ; Temperature Range Low: -55°C; Device Class L1: Passive Components
U20 U21 = CMP-0272-00100-3: Single-Supply, Rail-to-Rail Operational Amplifier MicroAmplifier(TM) Series, 2.7 to 5 V, -40 to 85 degC, 14-pin SOIC (D14), Green (RoHS & no Sb/Br); Manufacturer: Texas Instruments; Iq per channel(Max)(mA): 0.95; Sub Family: Low Input Bias Current Amp (<=10pA), Low Offset Voltage Amplifier (<=500uV), Low Supply Voltage Amplifier (<=2.7V), Precision Amplifier; Vn at 1kHz(Typ)(nV/rtHz): 25; Total Supply Voltage(Min)(+5V is 5, +/-5V is 10): 2.7; Slew Rate(Typ)(V/us): 6; Total Supply Voltage(Max)(+5V is 5, +/-5V is 10): 5; Number of Channels: 4; CMRR(Min)(dB): 80; Vio (25C)(Max)(mV): 0.5; Offset Drift(Typ)(uV/C): 2.5; IIB(Max)(pA): 10; ComponentLink1Description: Manufacturer URL; PackageDescription: 14-Pin Plastic Small Outline, Body 8.65 x 3.9 mm, Pitch 1.27 mm; ComponentLink2URL: http://www.ti.com/general/docs/lit/getliterature.tsp?genericPartNumber=OPA4340&fileType=pdf; Mounting Technology: Surface Mount; Code_JEDEC: MS-012; ComponentLink3URL: http://www.ti.com/lit/ml/mpds177g/mpds177g.pdf; ComponentLink3Description: Package Specification; ComponentLink1URL: http://www.ti.com/; ComponentLink2Description: Datasheet; Eco-Plan: Green (RoHS & no Sb/Br); PartNumber: OPA4340UA; PackageReference: D0014A; PackageVersion: 4040047-5/M, 06/2011; DatasheetVersion: SBOS073B

## Nets that join several sheets
3V3_DIGITAL: U_OBC_Core (22 pins), U_SDRAM (7 pins), U_eMMC (*1.E6 *1.M4), U_ADCS_Isolated (U2.1 U3.1), U_Interfaces_Connectors (J2.2 P2.14 P3.1), U_ADCS_IMU (8 pins), U_ADCS_SunSensors (U20.4 U21.4)
DGND: U_OBC_Core (20 pins), U_SDRAM (7 pins), U_eMMC (*1.A6), U_ADCS_Isolated (U2.8 U3.8), U_Interfaces_Connectors (7 pins), U_ADCS_IMU (10 pins), U_ADCS_SunSensors (14 pins)
V_BATT: U_ADCS_Isolated (C10.1 U4.12 U5.12 U8.2), U_Interfaces_Connectors (J5.1)
AOUT1: U_ADCS_Isolated (U4.2), U_Interfaces_Connectors (J3.1)
AOUT2: U_ADCS_Isolated (U4.4), U_Interfaces_Connectors (J3.2)
BOUT1: U_ADCS_Isolated (U4.7), U_Interfaces_Connectors (J4.1)
BOUT2: U_ADCS_Isolated (U4.5), U_Interfaces_Connectors (J4.2)
COUT1: U_ADCS_Isolated (U5.2), U_Interfaces_Connectors (J6.1)
COUT2: U_ADCS_Isolated (U5.4), U_Interfaces_Connectors (J6.2)
D0: U_eMMC (*1.A3), U_Interfaces_Connectors (P2.1)
D1: U_eMMC (*1.A4), U_Interfaces_Connectors (P2.2)
D2: U_eMMC (*1.A5), U_Interfaces_Connectors (P2.3)
D3: U_eMMC (*1.B2), U_Interfaces_Connectors (P2.4)
D4: U_eMMC (*1.B3), U_Interfaces_Connectors (P2.5)
D5: U_eMMC (*1.B4), U_Interfaces_Connectors (P2.6)
D6: U_eMMC (*1.B5), U_Interfaces_Connectors (P2.7)
D7: U_eMMC (*1.B6), U_Interfaces_Connectors (P2.8)
I2C_SCL: U_OBC_Core (R7.2 U1.164), U_Interfaces_Connectors (P2.13 P3.3)
I2C_SDA: U_OBC_Core (R6.1 U1.165), U_Interfaces_Connectors (P2.12 P3.4)
IMU_SCL: U_OBC_Core (R9.2 U1.79), U_ADCS_IMU (U7.2)
IMU_SDA: U_OBC_Core (R8.1 U1.80), U_ADCS_IMU (U7.4)
NetJ5_2: U_OBC_Core (U1.1), U_Interfaces_Connectors (J5.2)
PWM_A1: U_OBC_Core (U1.77), U_ADCS_Isolated (U3.3)
PWM_A2: U_OBC_Core (U1.76), U_ADCS_Isolated (U3.4)
PWM_B1: U_OBC_Core (U1.74), U_ADCS_Isolated (U3.5)
PWM_B2: U_OBC_Core (U1.70), U_ADCS_Isolated (U3.6)
PWM_C1: U_OBC_Core (U1.5), U_ADCS_Isolated (U2.3)
PWM_C2: U_OBC_Core (U1.4), U_ADCS_Isolated (U2.4)
SPI_MISO: U_OBC_Core (R4.1), U_Interfaces_Connectors (P1.3)
SPI_MOSI: U_OBC_Core (R5.1), U_Interfaces_Connectors (P1.4)
SPI_NSS: U_OBC_Core (R2.1), U_Interfaces_Connectors (P1.1)
SPI_SCK: U_OBC_Core (R3.1), U_Interfaces_Connectors (P1.2)
SUN_XN: U_OBC_Core (U1.108), U_ADCS_SunSensors (R11.2 U20.7)
SUN_XP: U_OBC_Core (U1.109), U_ADCS_SunSensors (R10.2 U20.1)
SUN_YN: U_OBC_Core (U1.106), U_ADCS_SunSensors (R13.2 U20.14)
SUN_YP: U_OBC_Core (U1.107), U_ADCS_SunSensors (R12.2 U20.8)
SUN_ZN: U_OBC_Core (U1.66), U_ADCS_SunSensors (R15.2 U21.7)
SUN_ZP: U_OBC_Core (U1.67), U_ADCS_SunSensors (R14.2 U21.1)